# Altium schematic sheet Top_Sheet.SchDoc: BLOCK DIAGRAM
size A4; DrawnBy: ENGR ASIM HAYAT; DocumentNumber: 1; SheetNumber: 1; SheetTotal: 6
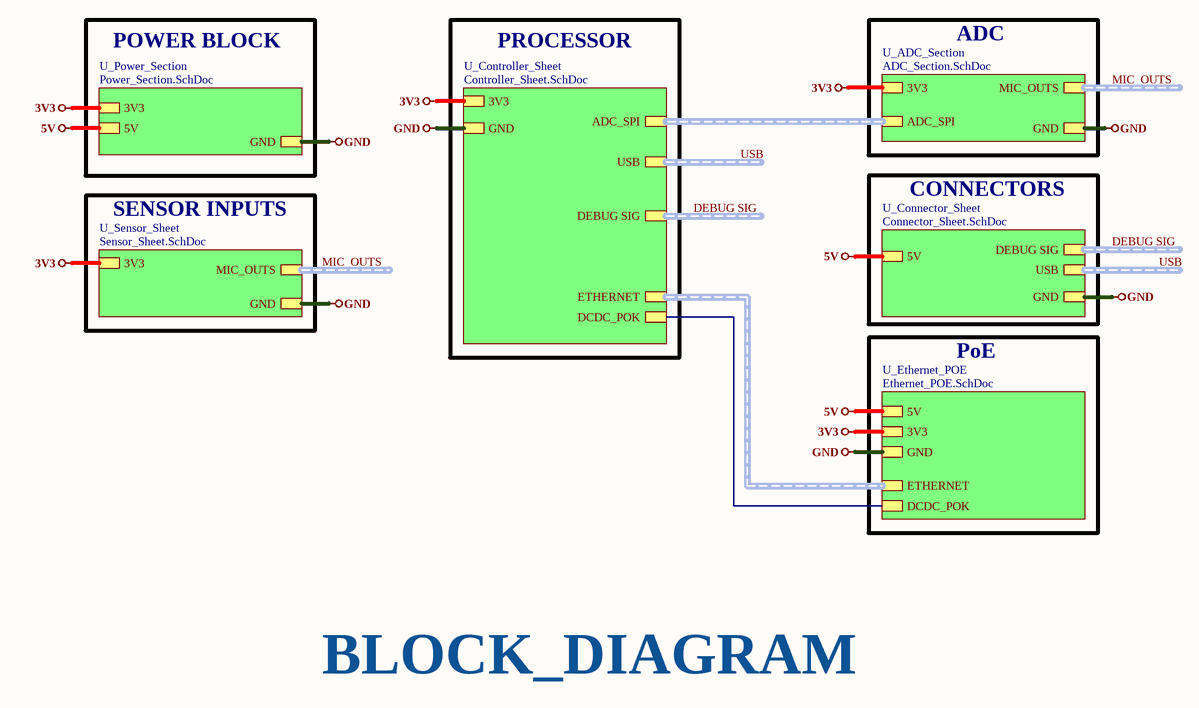
[diagram p0: Top_Sheet.SchDoc]

## Sub-sheets
U_ADC_Section = ADC_Section.SchDoc: MIC_OUTS (harness MIC_OUTS), ADC_SPI (harness ADC_SPI), 3V3, GND
U_Connector_Sheet = Connector_Sheet.SchDoc: GND, 5V, DEBUG SIG (harness DEBUG SIG), USB (harness USB)
U_Controller_Sheet = Controller_Sheet.SchDoc: ADC_SPI (harness ADC_SPI), 3V3, GND, USB (harness USB), DEBUG SIG (harness DEBUG SIG), ETHERNET (harness ETHERNET), DCDC_POK
U_Ethernet_POE = Ethernet_POE.SchDoc: ETHERNET (harness ETHERNET), 3V3, GND, 5V, DCDC_POK
U_Power_Section = Power_Section.SchDoc: 3V3, GND, 5V
U_Sensor_Sheet = Sensor_Sheet.SchDoc: MIC_OUTS (harness MIC_OUTS), 3V3, GND

## Nets
3V3: sheet U_Sensor_Sheet/3V3, sheet U_Power_Section/3V3, sheet U_ADC_Section/3V3, sheet U_Controller_Sheet/3V3, sheet U_Ethernet_POE/3V3
5V: sheet U_Power_Section/5V, sheet U_Connector_Sheet/5V, sheet U_Ethernet_POE/5V
GND: sheet U_Sensor_Sheet/GND, sheet U_Power_Section/GND, sheet U_Connector_Sheet/GND, sheet U_ADC_Section/GND, sheet U_Controller_Sheet/GND, sheet U_Ethernet_POE/GND
(unnamed): sheet U_Controller_Sheet/DCDC_POK, sheet U_Ethernet_POE/DCDC_POK

## Buses and harness runs
harness DEBUG SIG = sheet U_Connector_Sheet/DEBUG SIG
harness DEBUG SIG = sheet U_Controller_Sheet/DEBUG SIG
harness MIC_OUTS = sheet U_ADC_Section/MIC_OUTS
harness MIC_OUTS = sheet U_Sensor_Sheet/MIC_OUTS
harness sheet U_ADC_Section/ADC_SPI = sheet U_Controller_Sheet/ADC_SPI
harness sheet U_Controller_Sheet/ETHERNET = sheet U_Ethernet_POE/ETHERNET
harness USB = sheet U_Connector_Sheet/USB
harness USB = sheet U_Controller_Sheet/USB

## Notes on the sheet
- POWER BLOCK
- PROCESSOR
- ADC
- SENSOR INPUTS
- CONNECTORS
- PoE
- BLOCK_DIAGRAM
- File:
- Title:
- Date:
- Page
- Num:
- Total:
- Drawn By: Huzaifa Ali